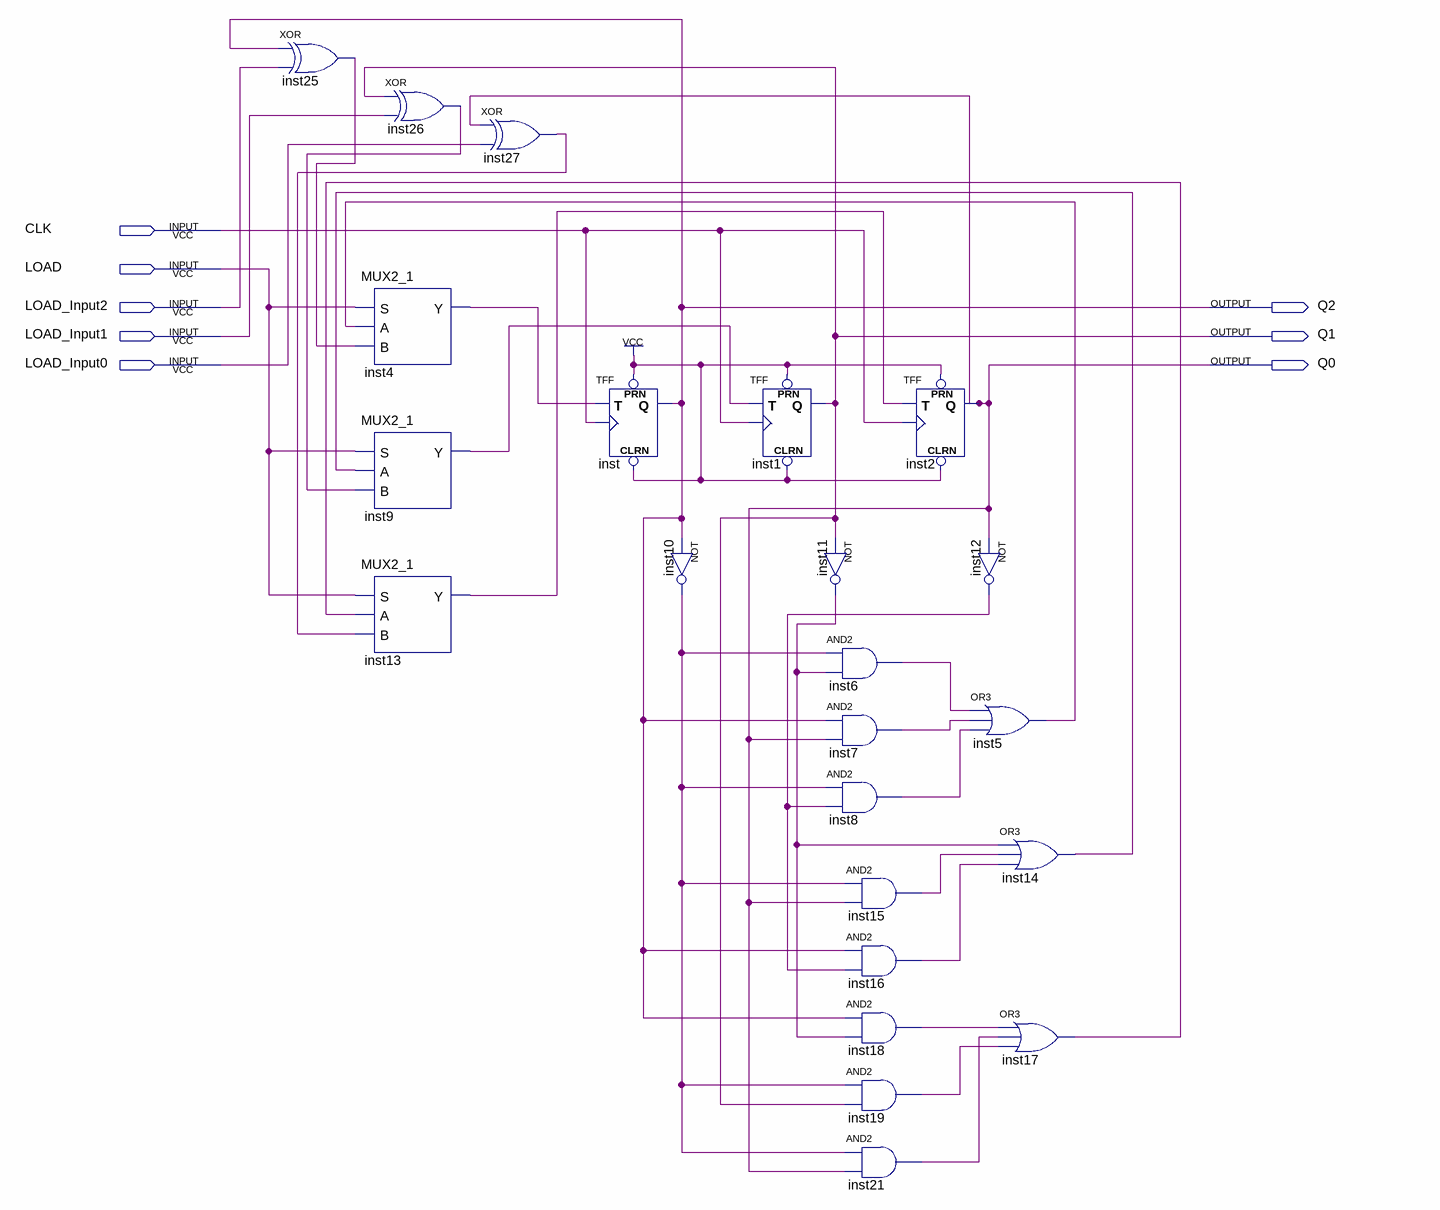
[diagram p0: schematic sheet]
// Quartus schematic cau02.bdf as structural Verilog: 23 symbols, 8 pins
module cau02 (
  input  CLK,
  input  LOAD,
  input  LOAD_Input2,
  input  LOAD_Input1,
  input  LOAD_Input0,
  output Q2,
  output Q1,
  output Q0
);

  wire inst4_y, inst5_out, inst6_out, inst7_out, inst8_out, inst9_y, inst10_out, inst11_out, inst12_out,
       inst13_y, inst14_out, inst15_out, inst16_out, inst17_out, inst18_out, inst19_out, inst21_out,
       inst25_out, inst26_out, inst27_out;

  xor inst25 (inst25_out, Q2, LOAD_Input2);
  xor inst26 (inst26_out, Q1, LOAD_Input1);
  MUX2_1 inst4 (.S(LOAD), .A(inst5_out), .B(inst25_out), .Y(inst4_y));
  MUX2_1 inst9 (.S(LOAD), .A(inst14_out), .B(inst26_out), .Y(inst9_y));
  MUX2_1 inst13 (.S(LOAD), .A(inst17_out), .B(inst27_out), .Y(inst13_y));
  xor inst27 (inst27_out, Q0, LOAD_Input0);
  TFF inst (.PRN(1'b1), .CLRN(1'b1), .T(inst4_y), .CLK(CLK), .Q(Q2));
  not inst10 (inst10_out, Q2);
  TFF inst1 (.PRN(1'b1), .CLRN(1'b1), .T(inst9_y), .CLK(CLK), .Q(Q1));
  not inst11 (inst11_out, Q1);
  and inst6 (inst6_out, inst10_out, inst11_out);
  and inst7 (inst7_out, Q2, Q0);
  and inst8 (inst8_out, inst10_out, inst12_out);
  and inst15 (inst15_out, inst10_out, Q0);
  and inst16 (inst16_out, Q2, inst12_out);
  and inst18 (inst18_out, Q2, inst11_out);
  and inst19 (inst19_out, inst10_out, Q1);
  and inst21 (inst21_out, inst10_out, Q0);
  TFF inst2 (.PRN(1'b1), .CLRN(1'b1), .T(inst13_y), .CLK(CLK), .Q(Q0));
  not inst12 (inst12_out, Q0);
  or inst5 (inst5_out, inst6_out, inst7_out, inst8_out);
  or inst14 (inst14_out, inst11_out, inst15_out, inst16_out);
  or inst17 (inst17_out, inst18_out, inst21_out, inst19_out);
endmodule
